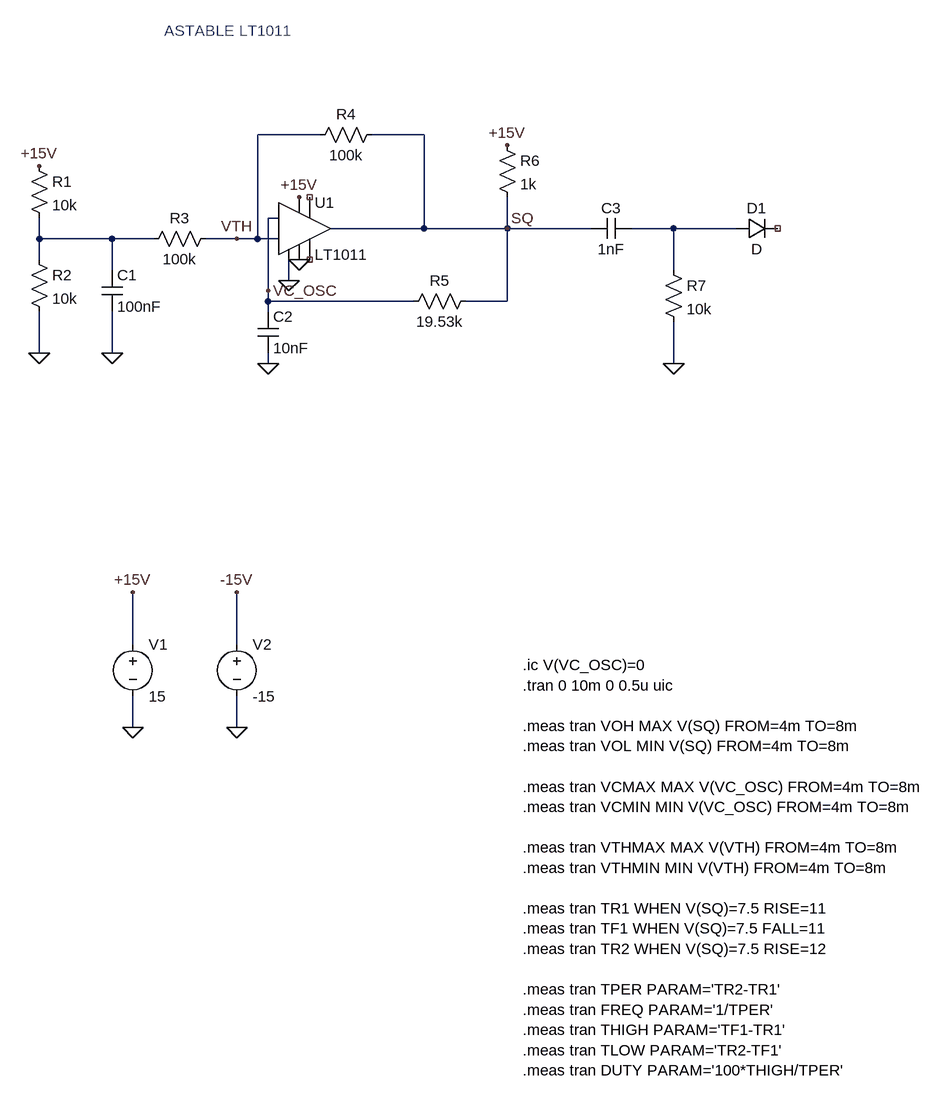
[diagram p0: schematic intentoaparte.asc]
intentoaparte.asc, the LTspice schematic file:
Version 4.1
SHEET 1 1688 1136
WIRE 80 -256 -16 -256
WIRE 240 -256 160 -256
WIRE 16 -128 0 -128
WIRE 240 -112 240 -256
WIRE 240 -112 96 -112
WIRE 368 -112 368 -160
WIRE 368 -112 240 -112
WIRE 496 -112 368 -112
WIRE 624 -112 560 -112
WIRE 720 -112 624 -112
WIRE -352 -96 -352 -128
WIRE -240 -96 -352 -96
WIRE -176 -96 -240 -96
WIRE -48 -96 -96 -96
WIRE -16 -96 -16 -256
WIRE -16 -96 -48 -96
WIRE 16 -96 -16 -96
WIRE -352 -64 -352 -96
WIRE -240 -48 -240 -96
WIRE 624 -48 624 -112
WIRE 32 -32 32 -64
WIRE 0 -16 0 -128
WIRE 0 0 0 -16
WIRE 224 0 0 0
WIRE 368 0 368 -112
WIRE 368 0 304 0
WIRE 0 16 0 0
WIRE -352 80 -352 16
WIRE -240 80 -240 16
WIRE 0 96 0 80
WIRE 624 96 624 32
WIRE -208 528 -208 448
WIRE -48 528 -48 448
WIRE -208 656 -208 608
WIRE -48 656 -48 608
FLAG -208 656 0
FLAG -48 656 0
FLAG -208 448 +15V
FLAG -48 448 -15V
FLAG -352 -208 +15V
FLAG -352 80 0
FLAG -240 80 0
FLAG 0 96 0
FLAG 368 -240 +15V
FLAG 32 -32 0
FLAG 48 -160 +15V
FLAG 368 -112 SQ
FLAG 48 -64 0
FLAG 0 -16 VC_OSC
FLAG -48 -96 VTH
FLAG 624 96 0
SYMBOL voltage -208 512 R0
WINDOW 123 0 0 Left 0
WINDOW 39 0 0 Left 0
SYMATTR InstName V1
SYMATTR Value 15
SYMBOL voltage -48 512 R0
WINDOW 123 0 0 Left 0
WINDOW 39 0 0 Left 0
SYMATTR InstName V2
SYMATTR Value -15
SYMBOL res -368 -224 R0
SYMATTR InstName R1
SYMATTR Value 10k
SYMBOL res -368 -80 R0
SYMATTR InstName R2
SYMATTR Value 10k
SYMBOL cap -256 -48 R0
SYMATTR InstName C1
SYMATTR Value 100nF
SYMBOL res -80 -112 R90
WINDOW 0 0 56 VBottom 2
WINDOW 3 32 56 VTop 2
SYMATTR InstName R3
SYMATTR Value 100k
SYMBOL Comparators\\LT1011 48 -112 R0
SYMATTR InstName U1
SYMBOL cap -16 16 R0
SYMATTR InstName C2
SYMATTR Value 10nF
SYMBOL res 176 -272 R90
WINDOW 0 0 56 VBottom 2
WINDOW 3 32 56 VTop 2
SYMATTR InstName R4
SYMATTR Value 100k
SYMBOL res 208 16 R270
WINDOW 0 32 56 VTop 2
WINDOW 3 0 56 VBottom 2
SYMATTR InstName R5
SYMATTR Value 19.53k
SYMBOL res 352 -256 R0
SYMATTR InstName R6
SYMATTR Value 1k
SYMBOL cap 560 -128 R90
WINDOW 0 0 32 VBottom 2
WINDOW 3 32 32 VTop 2
SYMATTR InstName C3
SYMATTR Value 1nF
SYMBOL res 608 -64 R0
SYMATTR InstName R7
SYMATTR Value 10k
SYMBOL diode 720 -96 R270
WINDOW 0 32 32 VTop 2
WINDOW 3 0 32 VBottom 2
SYMATTR InstName D1
TEXT 392 560 Left 2 !.ic V(VC_OSC)=0\n.tran 0 10m 0 0.5u uic\n \n.meas tran VOH MAX V(SQ) FROM=4m TO=8m\n.meas tran VOL MIN V(SQ) FROM=4m TO=8m\n \n.meas tran VCMAX MAX V(VC_OSC) FROM=4m TO=8m\n.meas tran VCMIN MIN V(VC_OSC) FROM=4m TO=8m\n \n.meas tran VTHMAX MAX V(VTH) FROM=4m TO=8m\n.meas tran VTHMIN MIN V(VTH) FROM=4m TO=8m\n \n.meas tran TR1 WHEN V(SQ)=7.5 RISE=11\n.meas tran TF1 WHEN V(SQ)=7.5 FALL=11\n.meas tran TR2 WHEN V(SQ)=7.5 RISE=12\n \n.meas tran TPER PARAM='TR2-TR1'\n.meas tran FREQ PARAM='1/TPER'\n.meas tran THIGH PARAM='TF1-TR1'\n.meas tran TLOW PARAM='TR2-TF1'\n.meas tran DUTY PARAM='100*THIGH/TPER'
TEXT -160 -416 Left 2 ;ASTABLE LT1011

The netlist it stands for:
* intentoaparte.asc
V1 +15V 0 15
V2 -15V 0 -15
R1 +15V N002 10k
R2 N002 0 10k
C1 N002 0 100nF
R3 VTH N002 100k
X§U1 0 VTH VC_OSC 0 NC_01 NC_02 SQ +15V LT1011
C2 VC_OSC 0 10nF
R4 SQ VTH 100k
R5 VC_OSC SQ 19.53k
R6 +15V SQ 1k
C3 N001 SQ 1nF
R7 N001 0 10k
D1 N001 NC_03 D
.model D D
.lib standard.dio
.ic V(VC_OSC)=0
.tran 0 10m 0 0.5u uic
.meas tran VOH MAX V(SQ) FROM=4m TO=8m
.meas tran VOL MIN V(SQ) FROM=4m TO=8m
.meas tran VCMAX MAX V(VC_OSC) FROM=4m TO=8m
.meas tran VCMIN MIN V(VC_OSC) FROM=4m TO=8m
.meas tran VTHMAX MAX V(VTH) FROM=4m TO=8m
.meas tran VTHMIN MIN V(VTH) FROM=4m TO=8m
.meas tran TR1 WHEN V(SQ)=7.5 RISE=11
.meas tran TF1 WHEN V(SQ)=7.5 FALL=11
.meas tran TR2 WHEN V(SQ)=7.5 RISE=12
.meas tran TPER PARAM='TR2-TR1'
.meas tran FREQ PARAM='1/TPER'
.meas tran THIGH PARAM='TF1-TR1'
.meas tran TLOW PARAM='TR2-TF1'
.meas tran DUTY PARAM='100*THIGH/TPER'
* ASTABLE LT1011
.lib LTC1.lib
.backanno
.end